# Altium project CountsFitness.PrjPCB (part 2 of 3)

## Sheet Controller_Section.SchDoc
size A4; DocumentNumber: 3; SheetNumber: 3; SheetTotal: 6
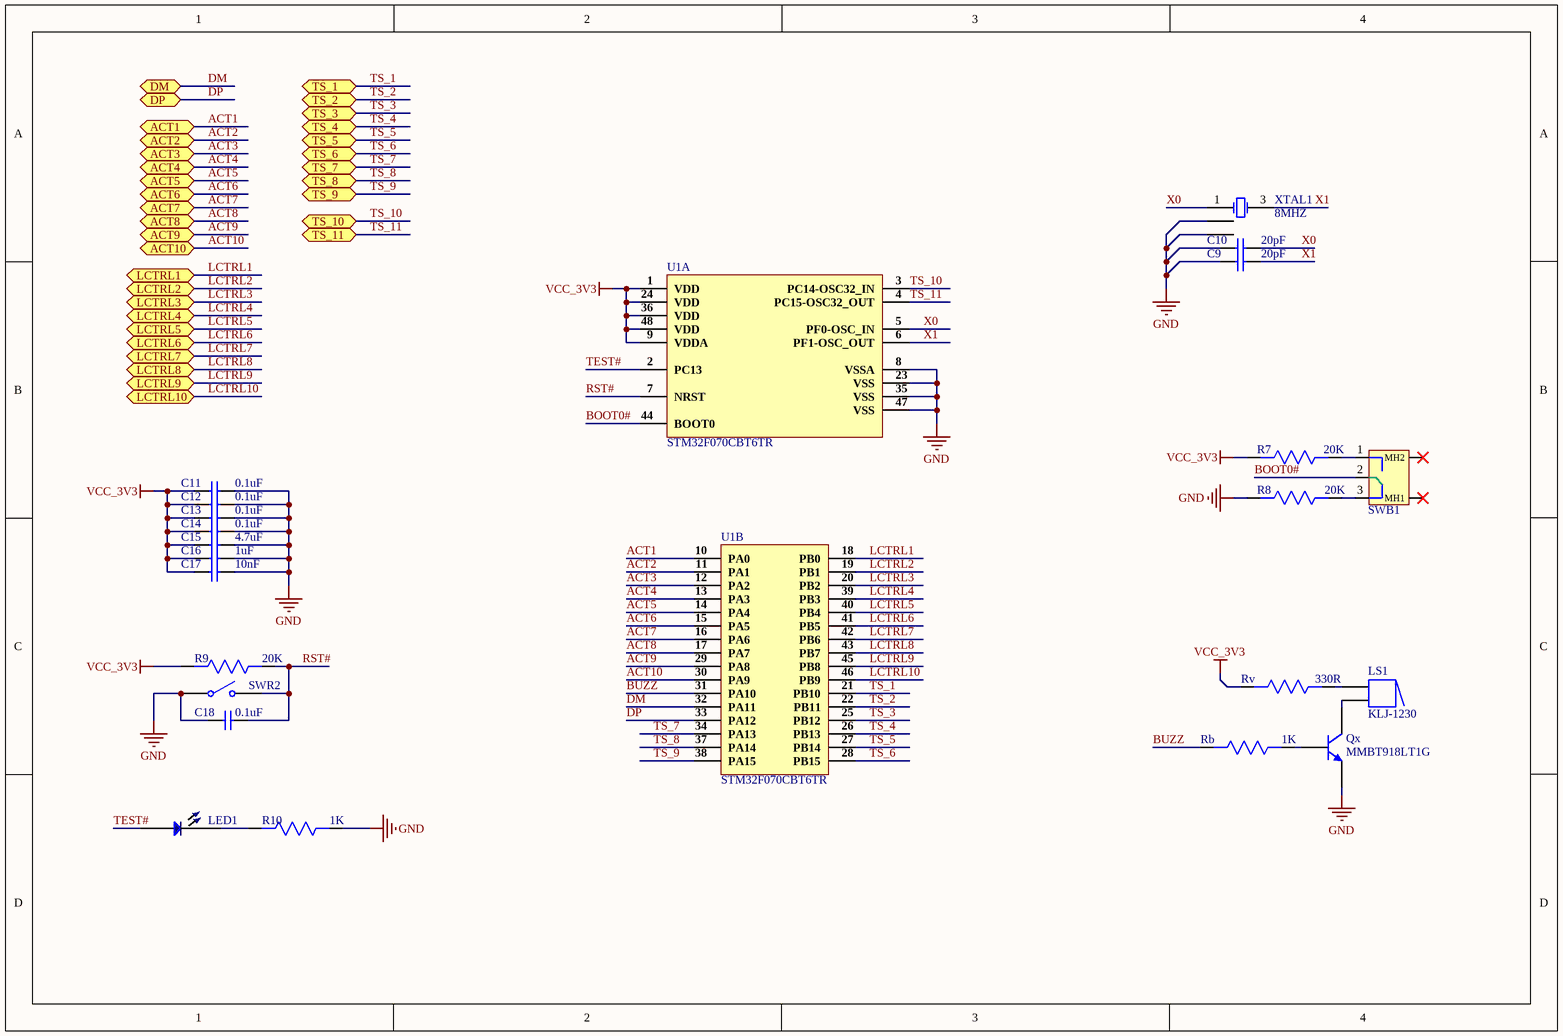
[diagram p2: Controller_Section.SchDoc]

### Parts
C9  20pF  [Cap 0201]
C10  20pF  [Cap 0201]
C11  0.1uF  [Cap0402]
C12  0.1uF  [Cap0402]
C13  0.1uF  [Cap0402]
C14  0.1uF  [Cap0402]
C15  4.7uF  [Cap0603]
C16  1uF  [Cap0402]
C17  10nF  [Cap0402]
C18  0.1uF  [Cap0402]
LED1  LTST-C191KGKT  [LED 0603]  (value not drawn)
LS1  KLJ-1230  [Buzzer]
Qx  MMBT918LT1G  [SOT23-3]
R7  20K  [Res0402]
R8  20K  [Res0402]
R9  20K  [Res0402]
R10  1K  [Res0402]
Rb  1K  [Res0402]
Rv  330R  [Res0603]
SWB1  OS102011MA1QN1  [OS102011MA1QN1]  (value not drawn)
SWR2  B3U-1000P  [B3U-1000P]  (value not drawn)
U1  STM32F070CBT6TR  [STM32F070CBT6TR]  (parts A,B of 2)
XTAL1  8MHZ  [7B08070001]

### Ports
ACT1 (bidir), ACT2 (bidir), ACT3 (bidir), ACT4 (bidir), ACT5 (bidir), ACT6 (bidir), ACT7 (bidir), ACT8 (bidir), ACT9 (bidir), ACT10 (bidir), DM (bidir), DP (bidir), LCTRL1 (bidir), LCTRL2 (bidir), LCTRL3 (bidir), LCTRL4 (bidir), LCTRL5 (bidir), LCTRL6 (bidir), LCTRL7 (bidir), LCTRL8 (bidir), LCTRL9 (bidir), LCTRL10 (bidir), TS_1 (bidir), TS_2 (bidir), TS_3 (bidir), TS_4 (bidir), TS_5 (bidir), TS_6 (bidir), TS_7 (bidir), TS_8 (bidir), TS_9 (bidir), TS_10 (bidir), TS_11 (bidir)

### Nets
GND: C9.2 C10.2 C11.2 C12.2 C13.2 C14.2 C15.2 C16.2 C17.2 C18.1 Qx.2(E) R8.2 R10.1 SWR2.1 U1.8(VSSA) U1.23(VSS) U1.35(VSS) U1.47(VSS) XTAL1.2(GND) XTAL1.4(GND)
VCC_3V3: C11.1 C12.1 C13.1 C14.1 C15.1 C16.1 C17.1 R7.2 R9.2 Rv.2 U1.1(VDD) U1.9(VDDA) U1.24(VDD) U1.36(VDD) U1.48(VDD)
ACT1: U1.10(PA0) ; port ACT1
ACT2: U1.11(PA1) ; port ACT2
ACT3: U1.12(PA2) ; port ACT3
ACT4: U1.13(PA3) ; port ACT4
ACT5: U1.14(PA4) ; port ACT5
ACT6: U1.15(PA5) ; port ACT6
ACT7: U1.16(PA6) ; port ACT7
ACT8: U1.17(PA7) ; port ACT8
ACT9: U1.29(PA8) ; port ACT9
ACT10: U1.30(PA9) ; port ACT10
BOOT0#: SWB1.2(+) U1.44(BOOT0)
BUZZ: Rb.2 U1.31(PA10)
DM: U1.32(PA11) ; port DM
DP: U1.33(PA12) ; port DP
LCTRL1: U1.18(PB0) ; port LCTRL1
LCTRL2: U1.19(PB1) ; port LCTRL2
LCTRL3: U1.20(PB2) ; port LCTRL3
LCTRL4: U1.39(PB3) ; port LCTRL4
LCTRL5: U1.40(PB4) ; port LCTRL5
LCTRL6: U1.41(PB5) ; port LCTRL6
LCTRL7: U1.42(PB6) ; port LCTRL7
LCTRL8: U1.43(PB7) ; port LCTRL8
LCTRL9: U1.45(PB8) ; port LCTRL9
LCTRL10: U1.46(PB9) ; port LCTRL10
RST#: C18.2 R9.1 SWR2.2 U1.7(NRST)
TEST#: LED1.1 U1.2(PC13)
TS_1: U1.21(PB10) ; port TS_1
TS_2: U1.22(PB11) ; port TS_2
TS_3: U1.25(PB12) ; port TS_3
TS_4: U1.26(PB13) ; port TS_4
TS_5: U1.27(PB14) ; port TS_5
TS_6: U1.28(PB15) ; port TS_6
TS_7: U1.34(PA13) ; port TS_7
TS_8: U1.37(PA14) ; port TS_8
TS_9: U1.38(PA15) ; port TS_9
TS_10: U1.3(PC14-OSC32_IN) ; port TS_10
TS_11: U1.4(PC15-OSC32_OUT) ; port TS_11
X0: C10.1 U1.5(PF0-OSC_IN) XTAL1.1(OSC1)
X1: C9.1 U1.6(PF1-OSC_OUT) XTAL1.3(OSC2)
NetLED1_2: LED1.2 R10.2
NetLS1_1: LS1.1 Rv.1
NetLS1_2: LS1.2 Qx.3(C)
NetQx_1: Qx.1(B) Rb.1
NetR7_1: R7.1 SWB1.1(+)
NetR8_1: R8.1 SWB1.3(+)

Not connected (* = marked no-connect by the designer): SWB1 MH1* MH2*

### Library data of the parts
C9 C10 = GJM0336C1E200JB01D: CAP CER 20PF 25V C0H 0201; Manufacturer: Murata; Tolerance: 5%; Supplier 1: Digi-Key; Manufacturer Part Number: GJM0336C1E200JB01D; Stock 1: 13650; Pricing 1: 1=0.1, 10=0.074, 100=0.0329, 500=0.02348, 1000=0.01845, 2500=0.01678, 5000=0.01543 (USD); Mount: Surface Mount; Case/Package: 0201; Case Code (Metric): 0603; Case Code (Imperial): 0201; Min Operating Temperature: -55°C; Max Operating Temperature: 125°C; Capacitance: 20pF; Voltage Rating: 25V; Packaging: Tape and Reel; Termination: SMD/SMT; Voltage Rating (DC): 25V; Length: 0.024inch; Width: 0.012inch; Thickness: 0.013inch; Lead Free: Lead Free; ComponentLink1URL: http://www.mouser.com/ds/2/281/c02e-2905.pdf?src-supplier=Mouser; ComponentLink1Description: http://www.mouser.com/ds/2/281/c02e-2905.pdf?src-supplier=Mouser; ComponentLink2URL: http://search.murata.co.jp/Ceramy/image/img/A01X/partnumbering_e_01.pdf?src-supplier=Digi-Key; ComponentLink2Description: http://search.murata.co.jp/Ceramy/image/img/A01X/partnumbering_e_01.pdf?src-supplier=Digi-Key; Supplier Part Number 1: 490-13313-1-ND
C11-C14 C18 = CC0402KRX7R7BB104: CAP CER 0.1UF 16V X7R 0402; Manufacturer: Yageo; Tolerance: 10%; Capacitance: 100nF; Supplier 1: Digi-Key; Manufacturer Part Number: CC0402KRX7R7BB104; Stock 1: 16982736; Pricing 1: 1=0.1, 10=0.034, 100=0.015, 500=0.0107, 1000=0.00841, 2500=0.00764, 5000=0.00703 (USD); Mount: Surface Mount; Case/Package: 0402; Number of Pins: 2; Case Code (Metric): 1005; Case Code (Imperial): 0402; Min Operating Temperature: -55°C; Max Operating Temperature: 125°C; Dielectric: X7R; Voltage Rating: 16V; Voltage Rating (DC): 16V; Packaging: Tape and Reel; Package Quantity: 1; Termination: SMD/SMT; Composition: Ceramic; Voltage: 16V; Length: 1mm; Height: 0.5mm; Width: 0.02inch; Thickness: 0.022inch; Depth: 0.5mm; Radiation Hardening: No; REACH SVHC: No SVHC; Lead Free: Lead Free; Halogen Free: Halogen Free; ComponentLink1URL: http://www.yageo.com/documents/recent/UPY-GPHC_X7R_6.3V-to-50V_8.pdf?src-supplier=Avnet+Europe; ComponentLink1Description: http://www.yageo.com/documents/recent/UPY-GPHC_X7R_6.3V-to-50V_8.pdf?src-supplier=Avnet+Europe; ComponentLink2URL: http://www.yageo.com/documents/recent/UPY-GPHC_X7R_6.3V-to-50V_18.pdf?src-supplier=Digi-Key; ComponentLink2Description: http://www.yageo.com/documents/recent/UPY-GPHC_X7R_6.3V-to-50V_18.pdf?src-supplier=Digi-Key; ComponentLink3URL: http://www.yageo.com/documents/recent/UPY-GPHC_X7R_6.3V-to-50V_8.pdf?src-supplier=Avnet; ComponentLink3Description: http://www.yageo.com/documents/recent/UPY-GPHC_X7R_6.3V-to-50V_8.pdf?src-supplier=Avnet; ComponentLink4URL: http://www.yageo.com/documents/recent/UPY-GPHC_X7R_6.3V-to-50V_18.pdf?src-supplier=Mouser; ComponentLink4Description: http://www.yageo.com/documents/recent/UPY-GPHC_X7R_6.3V-to-50V_18.pdf?src-supplier=Mouser; ComponentLink5URL: http://www.farnell.com/datasheets/2167236.pdf?src-supplier=Element14; ComponentLink5Description: http://www.farnell.com/datasheets/2167236.pdf?src-supplier=Element14; ComponentLink6URL: http://www.farnell.com/datasheets/1489800.pdf?src-supplier=Element14; ComponentLink6Description: http://www.farnell.com/datasheets/1489800.pdf?src-supplier=Element14; Supplier Part Number 1: 311-1338-1-ND
C15 = CL10A475KA8NQNC: CAP CER 4.7UF 25V X5R 0603; Manufacturer: Samsung; Tolerance: 10%; Supplier 1: Digi-Key; Manufacturer Part Number: CL10A475KA8NQNC; Stock 1: 2252340; Pricing 1: 1=0.37, 10=0.255, 100=0.1528, 500=0.11456, 1000=0.09675 (USD); Mount: Surface Mount; Case/Package: 0603; Case Code (Metric): 1608; Case Code (Imperial): 0603; Contact Plating: Tin; Min Operating Temperature: -55°C; Max Operating Temperature: 85°C; Package Quantity: 1; Packaging: Tape and Reel; Capacitance: 4.7uF; Voltage Rating: 25V; Dielectric: X5R; Termination: Wraparound; Length: 1.6mm; Width: 0.031inch; Thickness: 0.035inch; Depth: 0.8mm; Lead Free: Lead Free; ComponentLink1URL: http://www.samsungsem.com/kr/support/product-search/mlcc/CL10A475KA8NQNC.jsp?src-supplier=Digi-Key; ComponentLink1Description: http://www.samsungsem.com/kr/support/product-search/mlcc/CL10A475KA8NQNC.jsp?src-supplier=Digi-Key; Supplier Part Number 1: 1276-1900-1-ND
C16 = GRM155R61E105KA12D: CAP CER 1UF 25V X5R 0402; Manufacturer: Murata; Material: Ceramic; Tolerance: 10%; Supplier 1: Digi-Key; Manufacturer Part Number: GRM155R61E105KA12D; Stock 1: 1194305; Pricing 1: 1=0.11, 10=0.077, 100=0.0363, 500=0.02546, 1000=0.02108, 2500=0.01962, 5000=0.01795 (USD); Mount: Surface Mount; Case/Package: 0402; Weight: 0.000212oz; Case Code (Metric): 1005; Case Code (Imperial): 0402; Min Operating Temperature: -55°C; Max Operating Temperature: 85°C; Capacitance: 1uF; Voltage Rating: 25V; Packaging: Tape and Reel; Dielectric: X5R; Voltage: 25V; Termination: SMD/SMT; Voltage Rating (DC): 25V; Package Quantity: 10000; Length: 1mm; Height: 0.5mm; Width: 0.5mm; Thickness: 0.022inch; Depth: 0.5mm; REACH SVHC: No SVHC; Lead Free: Lead Free; ComponentLink1URL: http://www.farnell.com/datasheets/2048341.pdf?src-supplier=Element14; ComponentLink1Description: http://www.farnell.com/datasheets/2048341.pdf?src-supplier=Element14; Supplier Part Number 1: 490-10017-1-ND
C17 = CC0402KRX7R8BB103: CAP CER 10000PF 25V X7R 0402; Manufacturer: Yageo; Tolerance: 10%; Supplier 1: Digi-Key; Manufacturer Part Number: CC0402KRX7R8BB103; Stock 1: 0; Pricing 1: 1=0.1, 10=0.021, 100=0.0093, 500=0.00666, 1000=0.00523, 2500=0.00476, 5000=0.00438 (USD); Mount: Surface Mount; Case/Package: 0402; Case Code (Metric): 1005; Case Code (Imperial): 0402; Min Operating Temperature: -55°C; Max Operating Temperature: 125°C; Capacitance: 10nF; Dielectric: X7R; Voltage Rating: 25V; Package Quantity: 1; Packaging: Tape and Reel; Voltage Rating (DC): 25V; Termination: SMD/SMT; Composition: Ceramic; Length: 1mm; Height: 0.5mm; Depth: 0.5mm; Width: 0.02inch; Thickness: 0.022inch; Radiation Hardening: No; REACH SVHC: Unknown; Lead Free: Lead Free; Halogen Free: Halogen Free; ComponentLink1URL: http://www.yageo.com/documents/recent/UPY-GPHC_X7R_6.3V-to-50V_18.pdf?src-supplier=Digi-Key; ComponentLink1Description: http://www.yageo.com/documents/recent/UPY-GPHC_X7R_6.3V-to-50V_18.pdf?src-supplier=Digi-Key; ComponentLink2URL: https://www.verical.com/server-webapp/html/getDatasheet?partID=375418&src-supplier=Verical; ComponentLink2Description: https://www.verical.com/server-webapp/html/getDatasheet?partID=375418&src-supplier=Verical; ComponentLink3URL: http://www.yageo.com/documents/recent/UPY-GPHC_X7R_6.3V-to-50V_8.pdf?src-supplier=Avnet; ComponentLink3Description: http://www.yageo.com/documents/recent/UPY-GPHC_X7R_6.3V-to-50V_8.pdf?src-supplier=Avnet; ComponentLink4URL: https://4donline.ihs.com/images/VipMasterIC/IC/YAGO/YAGO-S-A0003557223/YAGO-S-A0003557223-1.pdf?hkey=52A5661711E402568146F3353EA87419&src-supplier=Element14; ComponentLink4Description: https://4donline.ihs.com/images/VipMasterIC/IC/YAGO/YAGO-S-A0003557223/YAGO-S-A0003557223-1.pdf?hkey=52A5661711E402568146F3353EA87419&src-supplier=Element14; ComponentLink5URL: http://www.farnell.com/datasheets/2167236.pdf?src-supplier=Element14; ComponentLink5Description: http://www.farnell.com/datasheets/2167236.pdf?src-supplier=Element14; ComponentLink6URL: http://www.mouser.com/ds/2/447/Yageo_UPY-GP_NP0_16V-to-50V_9-358835.pdf?src-supplier=Mouser; ComponentLink6Description: http://www.mouser.com/ds/2/447/Yageo_UPY-GP_NP0_16V-to-50V_9-358835.pdf?src-supplier=Mouser; Supplier Part Number 1: 311-1337-1-ND
LED1 = LTST-C191KGKT: LED GREEN CLEAR SMD 0603; Manufacturer: Vishay Lite-On; Lens Color: Colorless; Luminous Intensity: 35mcd; Viewing Angle: 130°; Forward Voltage: 2V; Dominant Wavelength: 571nm; Test Current: 20mA; Wavelength: 574nm; Lens Style: Rectangular,Colorless; Forward Current: 30mA; Number of Elements: 1; Power Dissipation: 75mW; Reverse Voltage: 5V; Supplier 1: Digi-Key; Manufacturer Part Number: LTST-C191KGKT; Stock 1: 134396; Pricing 1: 1=0.26, 10=0.192, 100=0.0909, 500=0.0606, 1000=0.04747, 2500=0.04646 (USD); Mount: Surface Mount; Case/Package: 0603; Number of Pins: 2; Color: Green; Case Code (Metric): 1608; Case Code (Imperial): 0603; Min Operating Temperature: -55°C; Max Operating Temperature: 85°C; Packaging: Tape and Reel; Package Quantity: 1; Lens Transparency: Clear; Illumination Color: Green; Number of LEDs: 1; Power Rating: 75mW; Max Power Dissipation: 75mW; Length: 1.6mm; Height: 0.55mm; Width: 0.8mm; Depth: 0.8mm; Radiation Hardening: No; Lead Free: Lead Free; ComponentLink1URL: http://optoelectronics.liteon.com/upload/download/DS22-2000-228/LTST-C191KGKT.PDF?src-supplier=Digi-Key; ComponentLink1Description: http://optoelectronics.liteon.com/upload/download/DS22-2000-228/LTST-C191KGKT.PDF?src-supplier=Digi-Key; Supplier Part Number 1: 160-1446-1-ND
LS1 = KLJ-1230: Piezo NO 80dB @ 3V, 10cm 3V 12mm x 12mm SMD 12*12*3 Buzzers RoHS; Manufacturer: KELIKING; Value: Custom; Manufacturer Part No: KLJ-1230; Package: Custom
Qx = MMBT918LT1G: NPN 50mA 15V 225mW SOT-23(SOT-23-3) Transistors (NPN/PNP) RoHS; Manufacturer: ON Semiconductor; hFE Min: 20; Frequency: 600MHz; Number of Elements: 1; Collector Base Voltage (VCBO): 30V; Emitter Base Voltage (VEBO): 3V; Collector Emitter Saturation Voltage: 400mV; Gain: 11dB; Power Dissipation: 300mW; Element Configuration: Single; Supplier 1: Digi-Key; Manufacturer Part Number: MMBT918LT1G; Stock 1: 8100; Pricing 1: 1=0.28, 10=0.229, 25=0.1916, 100=0.1214, 250=0.09372, 500=0.07988, 1000=0.05432 (USD); Case/Package: SOT-23-3; Number of Pins: 3; Contact Plating: Tin,Matte; Min Operating Temperature: -55°C; Max Operating Temperature: 150°C; Max Power Dissipation: 225mW; Package Quantity: 3000; Packaging: Tape and Reel; Polarity: NPN; Collector Emitter Voltage (VCEO): 15V; Max Collector Current: 50mA; Collector Emitter Breakdown Voltage: 15V; Transition Frequency: 600MHz; Max Breakdown Voltage: 15V; Max Frequency: 600MHz; Gain Bandwidth Product: 600MHz; Voltage Rating (DC): 15V; Current Rating: 50mA; Length: 3.04mm; Height: 1.01mm; Width: 1.4mm; Radiation Hardening: No; REACH SVHC: No SVHC; Lead Free: Lead Free; ComponentLink1URL: http://www.onsemi.com/pub/Collateral/MMBT918LT1-D.PDF?src-supplier=Avnet; ComponentLink1Description: http://www.onsemi.com/pub/Collateral/MMBT918LT1-D.PDF?src-supplier=Avnet; ComponentLink2URL: http://www.mouser.com/ds/2/308/MMBT918LT1-D-111406.pdf?src-supplier=Mouser; ComponentLink2Description: http://www.mouser.com/ds/2/308/MMBT918LT1-D-111406.pdf?src-supplier=Mouser; ComponentLink3URL: https://www.verical.com/server-webapp/html/getDatasheet?partID=70260&src-supplier=Verical; ComponentLink3Description: https://www.verical.com/server-webapp/html/getDatasheet?partID=70260&src-supplier=Verical; ComponentLink4URL: http://www.onsemi.com/pub/Collateral/MMBT918LT1-D.PDF?src-supplier=Future+Electronics; ComponentLink4Description: http://www.onsemi.com/pub/Collateral/MMBT918LT1-D.PDF?src-supplier=Future+Electronics; ComponentLink5URL: http://www.onsemi.com/pub/Collateral/MMBT918LT1-D.PDF?src-supplier=Digi-Key; ComponentLink5Description: http://www.onsemi.com/pub/Collateral/MMBT918LT1-D.PDF?src-supplier=Digi-Key; ComponentLink6URL: http://www.onsemi.com/pub/Collateral/MMBT918LT1-D.PDF?src-supplier=Avnet+Europe; ComponentLink6Description: http://www.onsemi.com/pub/Collateral/MMBT918LT1-D.PDF?src-supplier=Avnet+Europe; ComponentLink7URL: http://uk.rs-online.com/webdocs/1276/0900766b81276ae8.pdf?src-supplier=RSComponents; ComponentLink7Description: http://uk.rs-online.com/webdocs/1276/0900766b81276ae8.pdf?src-supplier=RSComponents; Supplier Part Number 1: MMBT918LT1GOSCT-ND
R7-R9 = RC0402JR-0720KL: RES SMD 20K OHM 1% 1/16W 0402; Manufacturer: Yageo; Resistance: 20kR; Power Rating: 62.5mW; Tolerance: 5%; Voltage Rating: 50V; Temperature Coefficient: 100ppm/°C; Max Power Dissipation: 63mW; ComponentLink1URL: https://industrial.panasonic.com/cdbs/www-data/pdf/RDA0000/AOA0000C301.pdf?src-supplier=Future+Electronics; ComponentLink1Description: https://industrial.panasonic.com/cdbs/www-data/pdf/RDA0000/AOA0000C301.pdf?src-supplier=Future+Electronics; ComponentLink2URL: http://www.jameco.com/Jameco/Products/ProdDS/1986781.pdf?src-supplier=Jameco; ComponentLink2Description: http://www.jameco.com/Jameco/Products/ProdDS/1986781.pdf?src-supplier=Jameco; ComponentLink3URL: http://www.farnell.com/datasheets/2059623.pdf?src-supplier=Farnell; ComponentLink3Description: http://www.farnell.com/datasheets/2059623.pdf?src-supplier=Farnell; ComponentLink4URL: http://industrial.panasonic.com/www-data/pdf/AOA0000/AOA0000CE1.pdf?src-supplier=Avnet; ComponentLink4Description: http://industrial.panasonic.com/www-data/pdf/AOA0000/AOA0000CE1.pdf?src-supplier=Avnet; ComponentLink5URL: http://www.alliedelec.com/m/d/51cd0790071e1666bdb9d00c57fcf960.pdf?src-supplier=Allied+Electronics; ComponentLink5Description: http://www.alliedelec.com/m/d/51cd0790071e1666bdb9d00c57fcf960.pdf?src-supplier=Allied+Electronics; ComponentLink6URL: http://industrial.panasonic.com/www-data/pdf/AOA0000/AOA0000CE1.pdf?src-supplier=Avnet+Europe; ComponentLink6Description: http://industrial.panasonic.com/www-data/pdf/AOA0000/AOA0000CE1.pdf?src-supplier=Avnet+Europe; ComponentLink7URL: http://www.farnell.com/datasheets/2059623.pdf?src-supplier=Element14; ComponentLink7Description: http://www.farnell.com/datasheets/2059623.pdf?src-supplier=Element14; ComponentLink8URL: http://industrial.panasonic.com/cdbs/www-data/pdf/RDA0000/AOA0000C301.pdf?src-supplier=Farnell; ComponentLink8Description: http://industrial.panasonic.com/cdbs/www-data/pdf/RDA0000/AOA0000C301.pdf?src-supplier=Farnell; ComponentLink9URL: http://industrial.panasonic.com/www-data/pdf/AOA0000/AOA0000CE1.pdf?src-supplier=Avnet+Asia; ComponentLink9Description: http://industrial.panasonic.com/www-data/pdf/AOA0000/AOA0000CE1.pdf?src-supplier=Avnet+Asia; ComponentLink10URL: http://www.yageo.com.tw/exep/pages/download/literatures/PYu-R_INT-thick_7.pdf?src-supplier=Digi-Key; ComponentLink10Description: http://www.yageo.com.tw/exep/pages/download/literatures/PYu-R_INT-thick_7.pdf?src-supplier=Digi-Key; ComponentLink11URL: http://www.yageo.com/NewPortal/yageodocoutput?fileName=/pdf/R-Chip/PYu-RC_51_RoHS_P_0.pdf&src-supplier=Digi-Key; ComponentLink11Description: http://www.yageo.com/NewPortal/yageodocoutput?fileName=/pdf/R-Chip/PYu-RC_51_RoHS_P_0.pdf&src-supplier=Digi-Key; ComponentLink12URL: http://www.yageo.com/documents/recent/PYu-RC0402_51_RoHS_L_6_r.pdf?src-supplier=Future+Electronics; ComponentLink12Description: http://www.yageo.com/documents/recent/PYu-RC0402_51_RoHS_L_6_r.pdf?src-supplier=Future+Electronics; ComponentLink13URL: http://www.mouser.com/ds/2/447/PYu-RC0402_51_RoHS_L_6_r-8721.pdf?src-supplier=Mouser; ComponentLink13Description: http://www.mouser.com/ds/2/447/PYu-RC0402_51_RoHS_L_6_r-8721.pdf?src-supplier=Mouser; ComponentLink14URL: http://www.yageo.com/documents/recent/PYu-RC0402_51_RoHS_L_6.pdf?src-supplier=Avnet+Europe; ComponentLink14Description: http://www.yageo.com/documents/recent/PYu-RC0402_51_RoHS_L_6.pdf?src-supplier=Avnet+Europe; Supplier 1: Digi-Key; Manufacturer Part Number: RC0402JR-0720KL; Stock 1: 4805429; Pricing 1: 1=0.1, 10=0.013, 100=0.0053, 1000=0.0024, 2500=0.0021, 5000=0.0017 (USD); Case/Package: 0402; Number of Pins: 2; Case Code (Metric): 1005; Case Code (Imperial): 0402; Min Operating Temperature: -55°C; Max Operating Temperature: 155°C; Package Quantity: 1; Packaging: Tape and Reel; Composition: Thick Film; Number of Terminations: 2; Termination: SMD/SMT; Military Standard: Not; Voltage Rating (DC): 50V; Features: Moisture Resistant; Length: 0.039inch; Height: 0.016inch; Width: 0.02inch; Depth: 0.5mm; REACH SVHC: No SVHC; Lead Free: Lead Free; ComponentLink15URL: http://www.yageo.com/documents/recent/PYu-RC_Group_51_RoHS_L_9.pdf?src-supplier=Digi-Key; ComponentLink15Description: http://www.yageo.com/documents/recent/PYu-RC_Group_51_RoHS_L_9.pdf?src-supplier=Digi-Key; ComponentLink16URL: http://www.farnell.com/datasheets/1018594.pdf?src-supplier=Element14; ComponentLink16Description: http://www.farnell.com/datasheets/1018594.pdf?src-supplier=Element14; Supplier Part Number 1: 311-20KJRCT-ND
R10 Rb = ERJ-2GEJ102X: RES SMD 1K OHM 5% 1/10W 0402; Manufacturer: Panasonic; Resistance: 1kR; Temperature Coefficient: 200ppm/°C; Voltage Rating: 50V; Power Rating: 100mW; Supplier 1: Digi-Key; Manufacturer Part Number: ERJ-2GEJ102X; Stock 1: 3855795; Pricing 1: 1=0.1, 10=0.032, 100=0.0129, 1000=0.00578, 2500=0.00502, 5000=0.00414 (USD); Mount: Surface Mount; Case/Package: 0402; Contact Plating: Tin; Case Code (Metric): 1005; Case Code (Imperial): 0402; Min Operating Temperature: -55°C; Max Operating Temperature: 155°C; Tolerance: 5%; Composition: Thick Film; Packaging: Tape and Reel; Package Quantity: 1; Number of Terminations: 2; Termination: SMD/SMT; Military Standard: Not; Max Power Dissipation: 100mW; Voltage Rating (DC): 50V; Features: Automotive AEC-Q200; Working Voltage: 50V; Length: 1mm; Height: 0.35mm; Width: 0.02inch; Depth: 0.5mm; Radiation Hardening: No; REACH SVHC: No SVHC; Lead Free: Lead Free; ComponentLink1URL: https://industrial.panasonic.com/cdbs/www-data/pdf/RDA0000/AOA0000C301.pdf?src-supplier=Future+Electronics; ComponentLink1Description: https://industrial.panasonic.com/cdbs/www-data/pdf/RDA0000/AOA0000C301.pdf?src-supplier=Future+Electronics; ComponentLink2URL: http://www.jameco.com/Jameco/Products/ProdDS/1986781.pdf?src-supplier=Jameco; ComponentLink2Description: http://www.jameco.com/Jameco/Products/ProdDS/1986781.pdf?src-supplier=Jameco; ComponentLink3URL: http://www.farnell.com/datasheets/2059623.pdf?src-supplier=Farnell; ComponentLink3Description: http://www.farnell.com/datasheets/2059623.pdf?src-supplier=Farnell; ComponentLink4URL: http://industrial.panasonic.com/www-data/pdf/AOA0000/AOA0000CE1.pdf?src-supplier=Avnet; ComponentLink4Description: http://industrial.panasonic.com/www-data/pdf/AOA0000/AOA0000CE1.pdf?src-supplier=Avnet; ComponentLink5URL: http://www.alliedelec.com/m/d/51cd0790071e1666bdb9d00c57fcf960.pdf?src-supplier=Allied+Electronics; ComponentLink5Description: http://www.alliedelec.com/m/d/51cd0790071e1666bdb9d00c57fcf960.pdf?src-supplier=Allied+Electronics; ComponentLink6URL: http://industrial.panasonic.com/www-data/pdf/AOA0000/AOA0000CE1.pdf?src-supplier=Avnet+Europe; ComponentLink6Description: http://industrial.panasonic.com/www-data/pdf/AOA0000/AOA0000CE1.pdf?src-supplier=Avnet+Europe; ComponentLink7URL: http://www.farnell.com/datasheets/2059623.pdf?src-supplier=Element14; ComponentLink7Description: http://www.farnell.com/datasheets/2059623.pdf?src-supplier=Element14; ComponentLink8URL: http://industrial.panasonic.com/cdbs/www-data/pdf/RDA0000/AOA0000C301.pdf?src-supplier=Farnell; ComponentLink8Description: http://industrial.panasonic.com/cdbs/www-data/pdf/RDA0000/AOA0000C301.pdf?src-supplier=Farnell; ComponentLink9URL: http://industrial.panasonic.com/www-data/pdf/AOA0000/AOA0000CE1.pdf?src-supplier=Avnet+Asia; ComponentLink9Description: http://industrial.panasonic.com/www-data/pdf/AOA0000/AOA0000CE1.pdf?src-supplier=Avnet+Asia; Supplier Part Number 1: P1.0KJCT-ND
Rv = RC0603FR-07330RL: RES SMD 330 OHM 1% 1/10W 0603; Manufacturer: Yageo; Temperature Coefficient: 100ppm/°C; Voltage Rating (DC): 50V; Power Rating: 100mW; Supplier 1: Digi-Key; Manufacturer Part Number: RC0603FR-07330RL; Stock 1: 9084897; Pricing 1: 1=0.1, 10=0.024, 100=0.0097, 1000=0.00437, 2500=0.00379 (USD); Case/Package: 0603; Number of Pins: 2; Case Code (Metric): 1608; Case Code (Imperial): 0603; Min Operating Temperature: -55°C; Max Operating Temperature: 155°C; Resistance: 330R; Tolerance: 1%; Composition: Thick Film; Packaging: Tape and Reel; Voltage Rating: 50V; Package Quantity: 1; Number of Terminations: 2; Termination: SMD/SMT; Max Power Dissipation: 100mW; Features: Moisture Resistant; Length: 1.6mm; Height: 0.45mm; Width: 0.8mm; Depth: 0.8mm; REACH SVHC: No SVHC; Lead Free: Lead Free; ComponentLink1URL: http://www.yageo.com/documents/recent/PYu-RC_Group_51_RoHS_L_10.pdf?src-supplier=Digi-Key; ComponentLink1Description: http://www.yageo.com/documents/recent/PYu-RC_Group_51_RoHS_L_10.pdf?src-supplier=Digi-Key; ComponentLink2URL: http://www.farnell.com/datasheets/2167052.pdf?src-supplier=Mouser; ComponentLink2Description: http://www.farnell.com/datasheets/2167052.pdf?src-supplier=Mouser; ComponentLink3URL: http://www.farnell.com/datasheets/1868787.pdf?src-supplier=Element14; ComponentLink3Description: http://www.farnell.com/datasheets/1868787.pdf?src-supplier=Element14; ComponentLink4URL: http://www.farnell.com/datasheets/443971.pdf?src-supplier=Element14; ComponentLink4Description: http://www.farnell.com/datasheets/443971.pdf?src-supplier=Element14; ComponentLink5URL: http://www.farnell.com/datasheets/1686128.pdf?src-supplier=Element14; ComponentLink5Description: http://www.farnell.com/datasheets/1686128.pdf?src-supplier=Element14; ComponentLink6URL: http://documents.rs-components.com/techlib://itc_doclist_GB.htm?stockno=5046499&src-supplier=RSComponents; ComponentLink6Description: http://documents.rs-components.com/techlib://itc_doclist_GB.htm?stockno=5046499&src-supplier=RSComponents; Supplier Part Number 1: 311-330HRCT-ND
SWB1 = OS102011MA1QN1: 2 Position SPDT Miniature Slide Switch 100MA 12V Through Hole, Right Angle; Manufacturer: ITT C&K; Mechanical Life: 10000Cycles; Body Material: Tin; Actuator Material: Polyoxymethylene,Acetal,Polyacetal; Contact Resistance: 20mR; Contact Style: Non-Shorting; Insulation Resistance: 100MR; Switch Travel: 2mm; Switch Function: On-On; Actuator Type: Standard; Actuator Length: 4mm; Supplier 1: Digi-Key; Manufacturer Part Number: OS102011MA1QN1; Stock 1: 24069; Pricing 1: 1=0.38, 10=0.363, 25=0.3552, 50=0.3176, 100=0.3024, 250=0.2948, 500=0.2495, 1000=0.2419, 5000=0.2117 (USD); Mount: Through Hole,Brackets,PCB; Contact Material: Copper Alloy,Brass,Silver; Contact Plating: Silver,Gold; Housing Material: Resin; Min Operating Temperature: -10°C; Max Operating Temperature: 70°C; Packaging: Bulk; Throw Configuration: SPDT; Voltage Rating (DC): 12V; Max Current Rating: 100mA; Contact Current Rating: 100mA; Max Voltage Rating (DC): 12V; Package Quantity: 300; Current Rating: 100mA; Termination: PC Pins; Electrical Life: 10000Cycles; Orientation: Right Angle; Length: 8.6mm; Width: 4.4mm; Depth: 8.4mm; Radiation Hardening: No; REACH SVHC: No SVHC; Lead Free: Lead Free; ComponentLink1URL: http://www.jameco.com/Jameco/Products/ProdDS/588220.pdf?src-supplier=Jameco; ComponentLink1Description: http://www.jameco.com/Jameco/Products/ProdDS/588220.pdf?src-supplier=Jameco; ComponentLink2URL: http://uk.rs-online.com/webdocs/1263/0900766b81263f61.pdf?src-supplier=RSComponents; ComponentLink2Description: http://uk.rs-online.com/webdocs/1263/0900766b81263f61.pdf?src-supplier=RSComponents; ComponentLink3URL: http://www.farnell.com/datasheets/1683358.pdf?src-supplier=Element14; ComponentLink3Description: http://www.farnell.com/datasheets/1683358.pdf?src-supplier=Element14; ComponentLink4URL: http://www1.futureelectronics.com/doc/C%20-%20K%20COMPONENTS/OS102011MA1QN1.pdf?src-supplier=Future+Electronics; ComponentLink4Description: http://www1.futureelectronics.com/doc/C%20-%20K%20COMPONENTS/OS102011MA1QN1.pdf?src-supplier=Future+Electronics; ComponentLink5URL: https://www.ckswitches.com/media/1428/os.pdf?src-supplier=Digi-Key; ComponentLink5Description: https://www.ckswitches.com/media/1428/os.pdf?src-supplier=Digi-Key; ComponentLink6URL: https://www.alliedelec.com/m/d/08271ccc8b1809c6b911a7d3c93f3e8a.pdf?src-supplier=Allied+Electronics; ComponentLink6Description: https://www.alliedelec.com/m/d/08271ccc8b1809c6b911a7d3c93f3e8a.pdf?src-supplier=Allied+Electronics; ComponentLink7URL: http://www.farnell.com/datasheets/2674787.pdf?src-supplier=Newark; ComponentLink7Description: http://www.farnell.com/datasheets/2674787.pdf?src-supplier=Newark; Supplier Part Number 1: CKN9559-ND
SWR2 = B3U-1000P: SWITCH TACTILE SPST-NO 0.05A 12V; Manufacturer: Omron; Mechanical Life: 200000Cycles; Operating Force: 1.5N; Throw Configuration: SPST; Current Rating: 50mA; Contact Resistance: 100mR; Illumination Type: Non-Illuminated,Illuminated; Switch Travel: 0.15mm; Switch Function: Off-Mom; Actuator Type: Standard; Actuator Length: 0.4mm; Ratings: Dust Proof,IP40; ComponentLink1URL: http://www.farnell.com/datasheets/60838.pdf?src-supplier=Farnell; ComponentLink1Description: http://www.farnell.com/datasheets/60838.pdf?src-supplier=Farnell; ComponentLink2URL: http://www.farnell.com/datasheets/60838.pdf?src-supplier=Element14; ComponentLink2Description: http://www.farnell.com/datasheets/60838.pdf?src-supplier=Element14; ComponentLink3URL: https://omronfs.omron.com/en_US/ecb/products/pdf/en-b3u.pdf?src-supplier=Digi-Key; ComponentLink3Description: https://omronfs.omron.com/en_US/ecb/products/pdf/en-b3u.pdf?src-supplier=Digi-Key; ComponentLink4URL: http://www.omron.com/ecb/products/pdf/en-b3u.pdf?src-supplier=Digi-Key; ComponentLink4Description: http://www.omron.com/ecb/products/pdf/en-b3u.pdf?src-supplier=Digi-Key; ComponentLink5URL: https://www.distrelec.biz/Web/Downloads/he/et/B3U_eng_datasheet.pdf?mime=application%2Fpdf&src-supplier=Distrelec; ComponentLink5Description: https://www.distrelec.biz/Web/Downloads/he/et/B3U_eng_datasheet.pdf?mime=application%2Fpdf&src-supplier=Distrelec; ComponentLink6URL: http://www.onlinecomponents.com/productFiles/mf-OM/en-b3u.pdf?src-supplier=Onlinecomponents.com; ComponentLink6Description: http://www.onlinecomponents.com/productFiles/mf-OM/en-b3u.pdf?src-supplier=Onlinecomponents.com; Supplier 1: Digi-Key; Manufacturer Part Number: B3U-1000P; Stock 1: 116454; Pricing 1: 1=1, 10=0.961, 25=0.9064, 50=0.7976, 100=0.7251, 250=0.68888, 500=0.67074, 1000=0.52571 (USD); Mount: Surface Mount; Weight: 0.000776oz; Contact Material: Silver; Min Operating Temperature: -25°C; Max Operating Temperature: 70°C; Packaging: Tape and Reel; Voltage Rating (DC): 12V; Package Quantity: 1; Max Current Rating: 50mA; Termination: SMD/SMT; Orientation: Straight; Max Voltage Rating (DC): 12V; Electrical Life: 200000Cycles; Insulation Resistance: 100MR; Contact Current Rating: 50mA; Length: 4mm; Height: 1.2mm; Depth: 2.5mm; Width: 3mm; REACH SVHC: Unknown; Lead Free: Lead Free; ComponentLink7URL: https://www.verical.com/server-webapp/html/getDatasheet?partID=552554&src-supplier=Verical; ComponentLink7Description: https://www.verical.com/server-webapp/html/getDatasheet?partID=552554&src-supplier=Verical; ComponentLink8URL: http://www.farnell.com/datasheets/1685550.pdf?src-supplier=Element14; ComponentLink8Description: http://www.farnell.com/datasheets/1685550.pdf?src-supplier=Element14; ComponentLink9URL: http://www.farnell.com/datasheets/2610940.pdf?src-supplier=Farnell; ComponentLink9Description: http://www.farnell.com/datasheets/2610940.pdf?src-supplier=Farnell; ComponentLink10URL: https://www.alliedelec.com/m/d/4c8a9ef82804fc3c241a13c1e298fd73.pdf?src-supplier=Allied+Electronics; ComponentLink10Description: https://www.alliedelec.com/m/d/4c8a9ef82804fc3c241a13c1e298fd73.pdf?src-supplier=Allied+Electronics; Supplier Part Number 1: SW1020DKR-ND
U1 = STM32F070CBT6TR: IC MCU 32BIT 128KB FLASH 48LQFP
XTAL1 = 7B08070001: CRYSTAL 8.0000MHZ 18PF SMD; Manufacturer: TXC; Frequency Stability: 20ppm; Supplier 1: Digi-Key; Manufacturer Part Number: 7B08070001; Stock 1: 0; Pricing 1: 1000=0.39 (USD); Mount: Surface Mount; Case/Package: SMD/SMT; Min Operating Temperature: -20°C; Max Operating Temperature: 75°C; Frequency: 8MHz; Load Capacitance: 18pF; Frequency Tolerance: 20ppm; Length: 0.197inch; Height: 0.041inch; Width: 0.126inch; ComponentLink1URL: http://www.txccorp.com/download/products/quartz_crystals/2015TXC_7B_19.pdf?src-supplier=Digi-Key; ComponentLink1Description: http://www.txccorp.com/download/products/quartz_crystals/2015TXC_7B_19.pdf?src-supplier=Digi-Key; ComponentLink2URL: http://www.mouser.com/ds/2/417/7b-5226.pdf?src-supplier=Mouser; ComponentLink2Description: http://www.mouser.com/ds/2/417/7b-5226.pdf?src-supplier=Mouser; Supplier Part Number 1: 7B08070001-ND

## Sheet Buttons_Section.SchDoc
size A4; DocumentNumber: 5; SheetNumber: 5; SheetTotal: 6
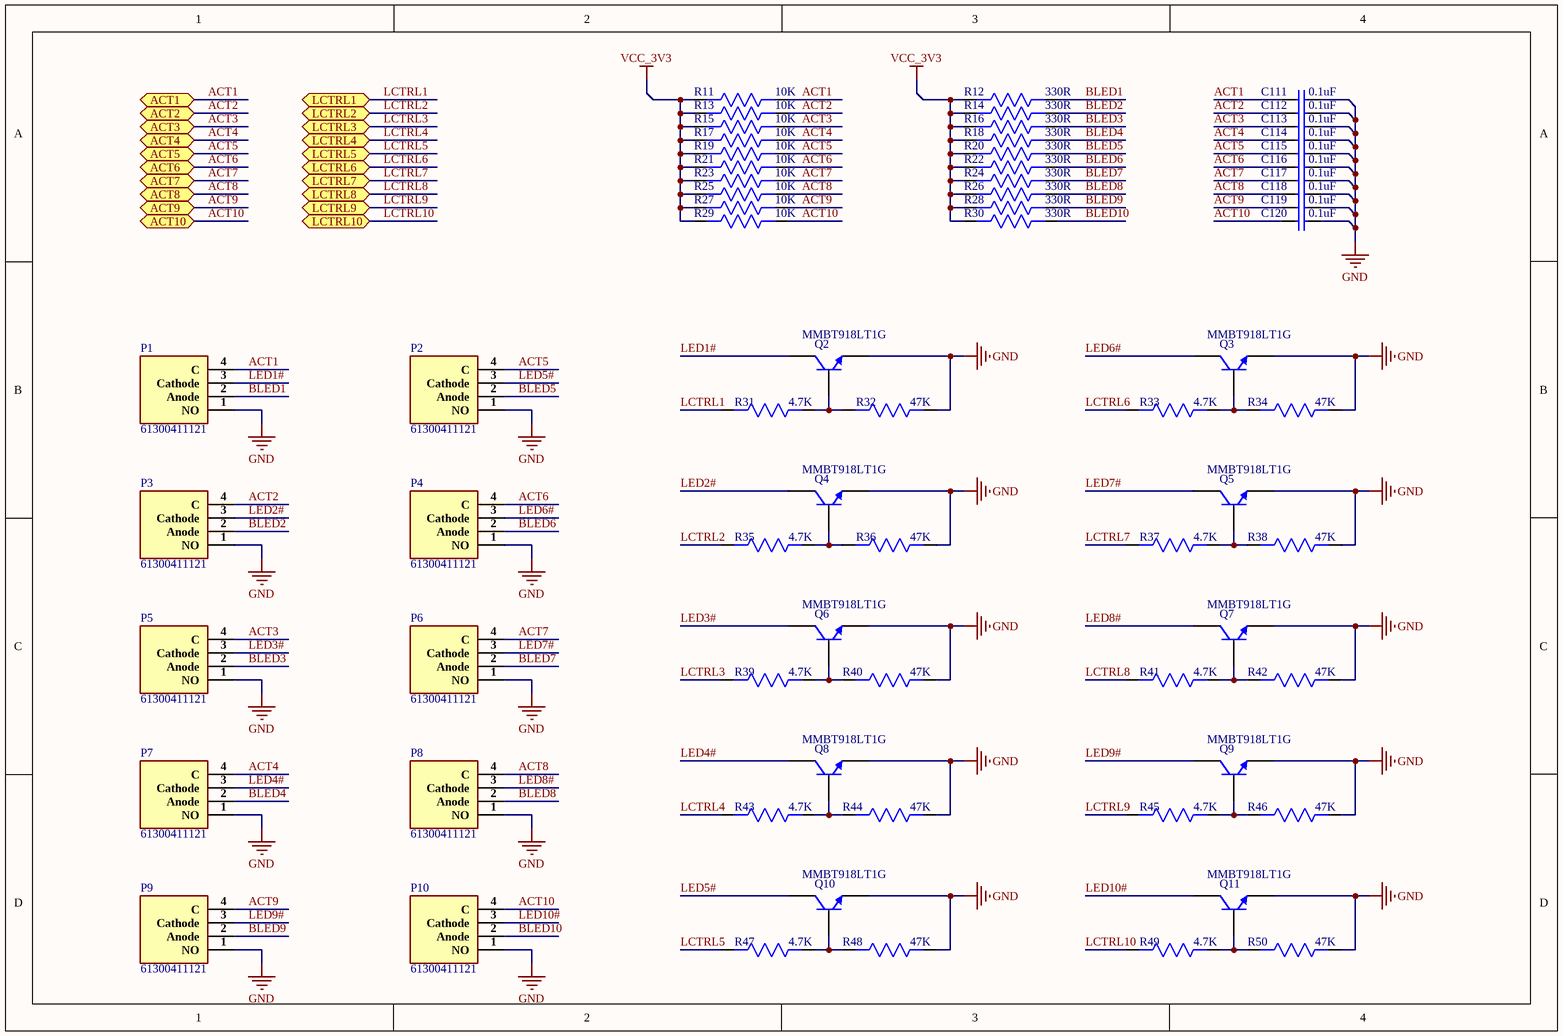
[diagram p3: Buttons_Section.SchDoc]

### Parts
C111  0.1uF  [Cap0402]
C112  0.1uF  [Cap0402]
C113  0.1uF  [Cap0402]
C114  0.1uF  [Cap0402]
C115  0.1uF  [Cap0402]
C116  0.1uF  [Cap0402]
C117  0.1uF  [Cap0402]
C118  0.1uF  [Cap0402]
C119  0.1uF  [Cap0402]
C120  0.1uF  [Cap0402]
P1  61300411121  [HDR1X4]
P2  61300411121  [HDR1X4]
P3  61300411121  [HDR1X4]
P4  61300411121  [HDR1X4]
P5  61300411121  [HDR1X4]
P6  61300411121  [HDR1X4]
P7  61300411121  [HDR1X4]
P8  61300411121  [HDR1X4]
P9  61300411121  [HDR1X4]
P10  61300411121  [HDR1X4]
Q2  MMBT918LT1G  [SOT23-3]
Q3  MMBT918LT1G  [SOT23-3]
Q4  MMBT918LT1G  [SOT23-3]
Q5  MMBT918LT1G  [SOT23-3]
Q6  MMBT918LT1G  [SOT23-3]
Q7  MMBT918LT1G  [SOT23-3]
Q8  MMBT918LT1G  [SOT23-3]
Q9  MMBT918LT1G  [SOT23-3]
Q10  MMBT918LT1G  [SOT23-3]
Q11  MMBT918LT1G  [SOT23-3]
R11  10K  [Res0402]
R12  330R  [Res0603]
R13  10K  [Res0402]
R14  330R  [Res0603]
R15  10K  [Res0402]
R16  330R  [Res0603]
R17  10K  [Res0402]
R18  330R  [Res0603]
R19  10K  [Res0402]
R20  330R  [Res0603]
R21  10K  [Res0402]
R22  330R  [Res0603]
R23  10K  [Res0402]
R24  330R  [Res0603]
R25  10K  [Res0402]
R26  330R  [Res0603]
R27  10K  [Res0402]
R28  330R  [Res0603]
R29  10K  [Res0402]
R30  330R  [Res0603]
R31  4.7K  [Res0402]
R32  47K  [Res0402]
R33  4.7K  [Res0402]
R34  47K  [Res0402]
R35  4.7K  [Res0402]
R36  47K  [Res0402]
R37  4.7K  [Res0402]
R38  47K  [Res0402]
R39  4.7K  [Res0402]
R40  47K  [Res0402]
R41  4.7K  [Res0402]
R42  47K  [Res0402]
R43  4.7K  [Res0402]
R44  47K  [Res0402]
R45  4.7K  [Res0402]
R46  47K  [Res0402]
R47  4.7K  [Res0402]
R48  47K  [Res0402]
R49  4.7K  [Res0402]
R50  47K  [Res0402]

### Ports
ACT1 (bidir), ACT2 (bidir), ACT3 (bidir), ACT4 (bidir), ACT5 (bidir), ACT6 (bidir), ACT7 (bidir), ACT8 (bidir), ACT9 (bidir), ACT10 (bidir), LCTRL1 (bidir), LCTRL2 (bidir), LCTRL3 (bidir), LCTRL4 (bidir), LCTRL5 (bidir), LCTRL6 (bidir), LCTRL7 (bidir), LCTRL8 (bidir), LCTRL9 (bidir), LCTRL10 (bidir)

### Nets
GND: C111.2 C112.2 C113.2 C114.2 C115.2 C116.2 C117.2 C118.2 C119.2 C120.2 P1.1(NO) P2.1(NO) P3.1(NO) P4.1(NO) P5.1(NO) P6.1(NO) P7.1(NO) P8.1(NO) P9.1(NO) P10.1(NO) Q2.2(E) Q3.2(E) Q4.2(E) Q5.2(E) Q6.2(E) Q7.2(E) Q8.2(E) Q9.2(E) Q10.2(E) Q11.2(E) R32.1 R34.1 R36.1 R38.1 R40.1 R42.1 R44.1 R46.1 R48.1 R50.1
VCC_3V3: R11.2 R12.2 R13.2 R14.2 R15.2 R16.2 R17.2 R18.2 R19.2 R20.2 R21.2 R22.2 R23.2 R24.2 R25.2 R26.2 R27.2 R28.2 R29.2 R30.2
ACT1: C111.1 P1.4(C) R11.1 ; port ACT1
ACT2: C112.1 P3.4(C) R13.1 ; port ACT2
ACT3: C113.1 P5.4(C) R15.1 ; port ACT3
ACT4: C114.1 P7.4(C) R17.1 ; port ACT4
ACT5: C115.1 P2.4(C) R19.1 ; port ACT5
ACT6: C116.1 P4.4(C) R21.1 ; port ACT6
ACT7: C117.1 P6.4(C) R23.1 ; port ACT7
ACT8: C118.1 P8.4(C) R25.1 ; port ACT8
ACT9: C119.1 P9.4(C) R27.1 ; port ACT9
ACT10: C120.1 P10.4(C) R29.1 ; port ACT10
BLED1: P1.2(Anode) R12.1
BLED2: P3.2(Anode) R14.1
BLED3: P5.2(Anode) R16.1
BLED4: P7.2(Anode) R18.1
BLED5: P2.2(Anode) R20.1
BLED6: P4.2(Anode) R22.1
BLED7: P6.2(Anode) R24.1
BLED8: P8.2(Anode) R26.1
BLED9: P9.2(Anode) R28.1
BLED10: P10.2(Anode) R30.1
LCTRL1: R31.1 ; port LCTRL1
LCTRL2: R35.1 ; port LCTRL2
LCTRL3: R39.1 ; port LCTRL3
LCTRL4: R43.1 ; port LCTRL4
LCTRL5: R47.1 ; port LCTRL5
LCTRL6: R33.1 ; port LCTRL6
LCTRL7: R37.1 ; port LCTRL7
LCTRL8: R41.1 ; port LCTRL8
LCTRL9: R45.1 ; port LCTRL9
LCTRL10: R49.1 ; port LCTRL10
LED1#: P1.3(Cathode) Q2.3(C)
LED2#: P3.3(Cathode) Q4.3(C)
LED3#: P5.3(Cathode) Q6.3(C)
LED4#: P7.3(Cathode) Q8.3(C)
LED5#: P2.3(Cathode) Q10.3(C)
LED6#: P4.3(Cathode) Q3.3(C)
LED7#: P6.3(Cathode) Q5.3(C)
LED8#: P8.3(Cathode) Q7.3(C)
LED9#: P9.3(Cathode) Q9.3(C)
LED10#: P10.3(Cathode) Q11.3(C)
NetQ2_1: Q2.1(B) R31.2 R32.2
NetQ3_1: Q3.1(B) R33.2 R34.2
NetQ4_1: Q4.1(B) R35.2 R36.2
NetQ5_1: Q5.1(B) R37.2 R38.2
NetQ6_1: Q6.1(B) R39.2 R40.2
NetQ7_1: Q7.1(B) R41.2 R42.2
NetQ8_1: Q8.1(B) R43.2 R44.2
NetQ9_1: Q9.1(B) R45.2 R46.2
NetQ10_1: Q10.1(B) R47.2 R48.2
NetQ11_1: Q11.1(B) R49.2 R50.2

### Library data of the parts
C111-C120 = CC0402KRX7R7BB104: as C11 on sheet Controller_Section; Supplier 1: Digi-Key; Manufacturer Part Number: CC0402KRX7R7BB104; Stock 1: 16982736; Pricing 1: 1=0.1, 10=0.034, 100=0.015, 500=0.0107, 1000=0.00841, 2500=0.00764, 5000=0.00703 (USD); Mount: Surface Mount; Case/Package: 0402; Number of Pins: 2; Case Code (Metric): 1005; Case Code (Imperial): 0402; Min Operating Temperature: -55°C; Max Operating Temperature: 125°C; Dielectric: X7R; Voltage Rating: 16V; Voltage Rating (DC): 16V; Packaging: Tape and Reel; Package Quantity: 1; Termination: SMD/SMT; Composition: Ceramic; Voltage: 16V; Length: 1mm; Height: 0.5mm; Width: 0.02inch; Thickness: 0.022inch; Depth: 0.5mm; Radiation Hardening: No; REACH SVHC: No SVHC; Lead Free: Lead Free; Halogen Free: Halogen Free; ComponentLink1URL: http://www.yageo.com/documents/recent/UPY-GPHC_X7R_6.3V-to-50V_8.pdf?src-supplier=Avnet+Europe; ComponentLink1Description: http://www.yageo.com/documents/recent/UPY-GPHC_X7R_6.3V-to-50V_8.pdf?src-supplier=Avnet+Europe; ComponentLink2URL: http://www.yageo.com/documents/recent/UPY-GPHC_X7R_6.3V-to-50V_18.pdf?src-supplier=Digi-Key; ComponentLink2Description: http://www.yageo.com/documents/recent/UPY-GPHC_X7R_6.3V-to-50V_18.pdf?src-supplier=Digi-Key; ComponentLink3URL: http://www.yageo.com/documents/recent/UPY-GPHC_X7R_6.3V-to-50V_8.pdf?src-supplier=Avnet; ComponentLink3Description: http://www.yageo.com/documents/recent/UPY-GPHC_X7R_6.3V-to-50V_8.pdf?src-supplier=Avnet; ComponentLink4URL: http://www.yageo.com/documents/recent/UPY-GPHC_X7R_6.3V-to-50V_18.pdf?src-supplier=Mouser; ComponentLink4Description: http://www.yageo.com/documents/recent/UPY-GPHC_X7R_6.3V-to-50V_18.pdf?src-supplier=Mouser; ComponentLink5URL: http://www.farnell.com/datasheets/2167236.pdf?src-supplier=Element14; ComponentLink5Description: http://www.farnell.com/datasheets/2167236.pdf?src-supplier=Element14; ComponentLink6URL: http://www.farnell.com/datasheets/1489800.pdf?src-supplier=Element14; ComponentLink6Description: http://www.farnell.com/datasheets/1489800.pdf?src-supplier=Element14; Supplier Part Number 1: 311-1338-1-ND
P1-P10 = 12MM Button: CONN HEADER VERT 4POS 2.54MM; Manufacturer: Wurth Electronics; Number of Positions: 4; Gender: Male; Connector Type: Male Pin; Pitch: 0.1inch; Supplier 1: Digi-Key; Manufacturer Part Number: 61300411121; Stock 1: 20544; Pricing 1: 1=0.18, 10=0.153, 25=0.1272, 50=0.106, 100=0.096, 1000=0.088 (USD); Mount: Through Hole; Contact Plating: Gold; Contact Material: Copper; Color: Black; Number of Rows: 1; Packaging: Bulk; Termination: Solder; Number of Contacts: 4; Contact Mating Length: 0.236inch; REACH SVHC: Unknown; Lead Free: Lead Free; ComponentLink1URL: http://www.farnell.com/cad/1737268.pdf?src-supplier=Element14; ComponentLink1Description: http://www.farnell.com/cad/1737268.pdf?src-supplier=Element14; ComponentLink2URL: https://katalog.we-online.de/em/datasheet/6130xx11121.pdf?src-supplier=Digi-Key; ComponentLink2Description: https://katalog.we-online.de/em/datasheet/6130xx11121.pdf?src-supplier=Digi-Key; Supplier Part Number 1: 732-5317-ND
Q2-Q11 = MMBT918LT1G: as Qx on sheet Controller_Section; Supplier 1: Digi-Key; Manufacturer Part Number: MMBT918LT1G; Stock 1: 8100; Pricing 1: 1=0.28, 10=0.229, 25=0.1916, 100=0.1214, 250=0.09372, 500=0.07988, 1000=0.05432 (USD); Case/Package: SOT-23-3; Number of Pins: 3; Contact Plating: Tin,Matte; Min Operating Temperature: -55°C; Max Operating Temperature: 150°C; Max Power Dissipation: 225mW; Package Quantity: 3000; Packaging: Tape and Reel; Polarity: NPN; Collector Emitter Voltage (VCEO): 15V; Max Collector Current: 50mA; Collector Emitter Breakdown Voltage: 15V; Transition Frequency: 600MHz; Max Breakdown Voltage: 15V; Max Frequency: 600MHz; Gain Bandwidth Product: 600MHz; Voltage Rating (DC): 15V; Current Rating: 50mA; Length: 3.04mm; Height: 1.01mm; Width: 1.4mm; Radiation Hardening: No; REACH SVHC: No SVHC; Lead Free: Lead Free; ComponentLink1URL: http://www.onsemi.com/pub/Collateral/MMBT918LT1-D.PDF?src-supplier=Avnet; ComponentLink1Description: http://www.onsemi.com/pub/Collateral/MMBT918LT1-D.PDF?src-supplier=Avnet; ComponentLink2URL: http://www.mouser.com/ds/2/308/MMBT918LT1-D-111406.pdf?src-supplier=Mouser; ComponentLink2Description: http://www.mouser.com/ds/2/308/MMBT918LT1-D-111406.pdf?src-supplier=Mouser; ComponentLink3URL: https://www.verical.com/server-webapp/html/getDatasheet?partID=70260&src-supplier=Verical; ComponentLink3Description: https://www.verical.com/server-webapp/html/getDatasheet?partID=70260&src-supplier=Verical; ComponentLink4URL: http://www.onsemi.com/pub/Collateral/MMBT918LT1-D.PDF?src-supplier=Future+Electronics; ComponentLink4Description: http://www.onsemi.com/pub/Collateral/MMBT918LT1-D.PDF?src-supplier=Future+Electronics; ComponentLink5URL: http://www.onsemi.com/pub/Collateral/MMBT918LT1-D.PDF?src-supplier=Digi-Key; ComponentLink5Description: http://www.onsemi.com/pub/Collateral/MMBT918LT1-D.PDF?src-supplier=Digi-Key; ComponentLink6URL: http://www.onsemi.com/pub/Collateral/MMBT918LT1-D.PDF?src-supplier=Avnet+Europe; ComponentLink6Description: http://www.onsemi.com/pub/Collateral/MMBT918LT1-D.PDF?src-supplier=Avnet+Europe; ComponentLink7URL: http://uk.rs-online.com/webdocs/1276/0900766b81276ae8.pdf?src-supplier=RSComponents; ComponentLink7Description: http://uk.rs-online.com/webdocs/1276/0900766b81276ae8.pdf?src-supplier=RSComponents; Supplier Part Number 1: MMBT918LT1GOSCT-ND
R11 R13 R15 R17 R19 R21 R23 R25 R27 R29 = RK73B1ETTP103J: RES 10K OHM 5% 1/10W 0402; Manufacturer: KOA Speer; Resistance: 10kR; Power Rating: 63mW; Voltage Rating: 50V; Temperature Coefficient: 200ppm/°C; Supplier 1: Digi-Key; Manufacturer Part Number: RK73B1ETTP103J; Stock 1: 2917894; Pricing 1: 1=0.1, 10=0.016, 100=0.0065, 1000=0.00292, 2500=0.00253, 5000=0.00209 (USD); Mount: Surface Mount; Case/Package: 0402; Case Code (Imperial): 0402; Case Code (Metric): 1005; Min Operating Temperature: -55°C; Max Operating Temperature: 155°C; Packaging: Tape and Reel; Tolerance: 5%; Package Quantity: 10000; Composition: Thick Film; Termination: SMD/SMT; Military Standard: Not; Voltage Rating (DC): 50V; Length: 1mm; Height: 0.35mm; Width: 0.5mm; Depth: 0.5mm; Lead Free: Lead Free; ComponentLink1URL: https://www.verical.com/server-webapp/html/getDatasheet?partID=89073&src-supplier=Verical; ComponentLink1Description: https://www.verical.com/server-webapp/html/getDatasheet?partID=89073&src-supplier=Verical; Supplier Part Number 1: 2019-RK73B1ETTP103JCT-ND
R12 R14 R16 R18 R20 R22 R24 R26 R28 R30 = RC0603FR-07330RL: as Rv on sheet Controller_Section; Supplier 1: Digi-Key; Manufacturer Part Number: RC0603FR-07330RL; Stock 1: 9084897; Pricing 1: 1=0.1, 10=0.024, 100=0.0097, 1000=0.00437, 2500=0.00379 (USD); Case/Package: 0603; Number of Pins: 2; Case Code (Metric): 1608; Case Code (Imperial): 0603; Min Operating Temperature: -55°C; Max Operating Temperature: 155°C; Resistance: 330R; Tolerance: 1%; Composition: Thick Film; Packaging: Tape and Reel; Voltage Rating: 50V; Package Quantity: 1; Number of Terminations: 2; Termination: SMD/SMT; Max Power Dissipation: 100mW; Features: Moisture Resistant; Length: 1.6mm; Height: 0.45mm; Width: 0.8mm; Depth: 0.8mm; REACH SVHC: No SVHC; Lead Free: Lead Free; ComponentLink1URL: http://www.yageo.com/documents/recent/PYu-RC_Group_51_RoHS_L_10.pdf?src-supplier=Digi-Key; ComponentLink1Description: http://www.yageo.com/documents/recent/PYu-RC_Group_51_RoHS_L_10.pdf?src-supplier=Digi-Key; ComponentLink2URL: http://www.farnell.com/datasheets/2167052.pdf?src-supplier=Mouser; ComponentLink2Description: http://www.farnell.com/datasheets/2167052.pdf?src-supplier=Mouser; ComponentLink3URL: http://www.farnell.com/datasheets/1868787.pdf?src-supplier=Element14; ComponentLink3Description: http://www.farnell.com/datasheets/1868787.pdf?src-supplier=Element14; ComponentLink4URL: http://www.farnell.com/datasheets/443971.pdf?src-supplier=Element14; ComponentLink4Description: http://www.farnell.com/datasheets/443971.pdf?src-supplier=Element14; ComponentLink5URL: http://www.farnell.com/datasheets/1686128.pdf?src-supplier=Element14; ComponentLink5Description: http://www.farnell.com/datasheets/1686128.pdf?src-supplier=Element14; ComponentLink6URL: http://documents.rs-components.com/techlib://itc_doclist_GB.htm?stockno=5046499&src-supplier=RSComponents; ComponentLink6Description: http://documents.rs-components.com/techlib://itc_doclist_GB.htm?stockno=5046499&src-supplier=RSComponents; Supplier Part Number 1: 311-330HRCT-ND
R31 R33 R35 R37 R39 R41 R43 R45 R47 R49 = RC0402FR-074K7L: RES SMD 4.7K OHM 1% 1/16W 0402; Manufacturer: Yageo; Voltage Rating (DC): 50V; Power Rating: 62.5mW; Resistance: 4.7kR; Temperature Coefficient: 100ppm/°C; Supplier 1: Digi-Key; Manufacturer Part Number 1: RC0402FR-074K7L; Stock 1: 26143098; Pricing 1: 1=0.1, 10=0.016, 100=0.0067, 1000=0.003, 2500=0.0026, 5000=0.0022 (USD); Case/Package: 0402; Number of Pins: 2; Case Code (Imperial): 0402; Case Code (Metric): 1005; Min Operating Temperature: -55°C; Max Operating Temperature: 155°C; Tolerance: 1%; Voltage Rating: 50V; Packaging: Tape and Reel; Composition: Thick Film; Termination: SMD/SMT; Military Standard: Not; Length: 1mm; Height: 0.32mm; Width: 0.5mm; Depth: 0.5mm; REACH SVHC: No SVHC; Lead Free: Lead Free; ComponentLink1URL: http://www.farnell.com/datasheets/1018594.pdf?src-supplier=Element14; ComponentLink1Description: http://www.farnell.com/datasheets/1018594.pdf?src-supplier=Element14; ComponentLink2URL: https://www.verical.com/server-webapp/html/getDatasheet?partID=328119&src-supplier=Verical; ComponentLink2Description: https://www.verical.com/server-webapp/html/getDatasheet?partID=328119&src-supplier=Verical; ComponentLink3URL: http://www.farnell.com/datasheets/1686128.pdf?src-supplier=Element14; ComponentLink3Description: http://www.farnell.com/datasheets/1686128.pdf?src-supplier=Element14; Supplier Part Number 1: 311-4.7KLRCT-ND
R32 R34 R36 R38 R40 R42 R44 R46 R48 R50 = RC0402FR-0747KL: RES SMD 47K OHM 1% 1/16W 0402; Manufacturer: Yageo; Power Rating: 62.5mW; Temperature Coefficient: 100ppm/°C; Voltage Rating: 50V; Resistance: 47kR; Max Power Dissipation: 63mW; Supplier 1: Digi-Key; Manufacturer Part Number: RC0402FR-0747KL; Stock 1: 0; Pricing 1: 1=0.1, 10=0.016, 100=0.0064, 1000=0.00289, 2500=0.00251, 5000=0.00207 (USD); Case/Package: 0402; Case Code (Imperial): 0402; Case Code (Metric): 1005; Min Operating Temperature: -55°C; Max Operating Temperature: 155°C; Tolerance: 1%; Packaging: Tape and Reel; Package Quantity: 1; Termination: SMD/SMT; Composition: Thick Film; Number of Terminations: 2; Military Standard: Not; Features: Moisture Resistant; Length: 1mm; Height: 0.016inch; Depth: 0.5mm; Width: 0.5mm; REACH SVHC: Unknown; Lead Free: Lead Free; ComponentLink1URL: http://www.yageo.com/documents/recent/PYu-RC0402_51_RoHS_L_6_r.pdf?src-supplier=Future+Electronics; ComponentLink1Description: http://www.yageo.com/documents/recent/PYu-RC0402_51_RoHS_L_6_r.pdf?src-supplier=Future+Electronics; ComponentLink2URL: http://www.farnell.com/datasheets/1018594.pdf?src-supplier=Element14; ComponentLink2Description: http://www.farnell.com/datasheets/1018594.pdf?src-supplier=Element14; ComponentLink3URL: https://www.verical.com/server-webapp/html/getDatasheet?partID=323748&src-supplier=Verical; ComponentLink3Description: https://www.verical.com/server-webapp/html/getDatasheet?partID=323748&src-supplier=Verical; ComponentLink4URL: http://www.yageo.com/documents/recent/PYu-RC_Group_51_RoHS_L_10.pdf?src-supplier=Digi-Key; ComponentLink4Description: http://www.yageo.com/documents/recent/PYu-RC_Group_51_RoHS_L_10.pdf?src-supplier=Digi-Key; Supplier Part Number 1: 311-47.0KLRDKR-ND